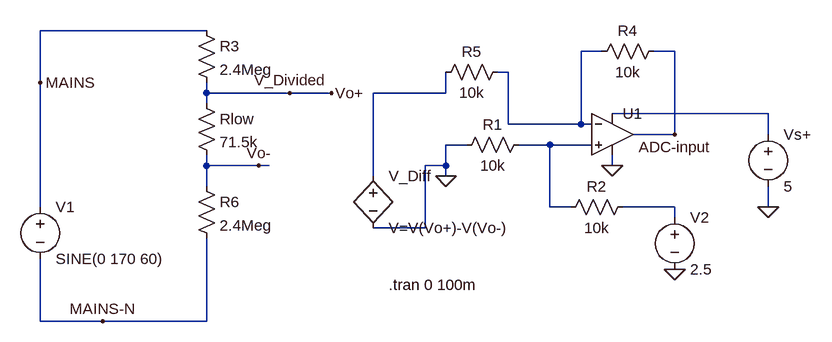
[diagram p0: schematic non-inverting_summing_amp.asc]
non-inverting_summing_amp.asc, the LTspice schematic file:
Version 4
SHEET 1 880 680
WIRE -176 -112 -432 -112
WIRE 432 -80 400 -80
WIRE 544 -80 512 -80
WIRE 288 -48 272 -48
WIRE -432 -32 -432 -112
WIRE -176 -16 -176 -32
WIRE -48 -16 -176 -16
WIRE 16 -16 -48 -16
WIRE 192 -16 192 -48
WIRE 192 -16 80 -16
WIRE -176 0 -176 -16
WIRE 688 16 448 16
WIRE 288 32 288 -48
WIRE 400 32 400 -80
WIRE 400 32 288 32
WIRE 416 32 400 32
WIRE 544 48 544 -80
WIRE 544 48 480 48
WIRE 688 48 688 16
WIRE 224 64 192 64
WIRE 352 64 304 64
WIRE 416 64 352 64
WIRE -176 96 -176 80
WIRE -96 96 -176 96
WIRE -80 96 -96 96
WIRE 192 96 192 64
WIRE 192 96 160 96
WIRE 448 96 448 80
WIRE 80 112 80 -16
WIRE 192 112 192 96
WIRE -176 128 -176 96
WIRE -432 160 -432 -32
WIRE 352 160 352 64
WIRE 384 160 352 160
WIRE 544 160 464 160
WIRE 688 160 688 128
WIRE 544 176 544 160
WIRE 160 192 160 96
WIRE 160 192 80 192
WIRE -432 336 -432 240
WIRE -336 336 -432 336
WIRE -176 336 -176 208
WIRE -176 336 -336 336
FLAG 544 256 0
FLAG 544 48 ADC-input
FLAG 16 -16 Vo+
FLAG 192 112 0
FLAG -96 96 Vo-
FLAG -432 -32 MAINS
FLAG -48 -16 V_Divided
FLAG -336 336 MAINS-N
FLAG 448 96 0
FLAG 688 160 0
SYMBOL voltage -432 144 R0
WINDOW 123 0 0 Left 0
WINDOW 39 0 0 Left 0
SYMATTR InstName V1
SYMATTR Value SINE(0 170 60)
SYMBOL OpAmps\\UniversalOpAmp 448 48 R0
SYMATTR InstName U1
SYMBOL res 320 48 R90
WINDOW 0 0 56 VBottom 2
WINDOW 3 32 56 VTop 2
SYMATTR InstName R1
SYMATTR Value 10k
SYMBOL res 288 -64 R90
WINDOW 0 0 56 VBottom 2
WINDOW 3 32 56 VTop 2
SYMATTR InstName R5
SYMATTR Value 10k
SYMBOL voltage 544 160 R0
SYMATTR InstName V2
SYMATTR Value 2.5
SYMBOL res 528 -96 R90
WINDOW 0 0 56 VBottom 2
WINDOW 3 32 56 VTop 2
SYMATTR InstName R4
SYMATTR Value 10k
SYMBOL voltage 688 32 R0
WINDOW 123 0 0 Left 0
WINDOW 39 0 0 Left 0
SYMATTR InstName Vs+
SYMATTR Value 5
SYMBOL res 480 144 R90
WINDOW 0 0 56 VBottom 2
WINDOW 3 32 56 VTop 2
SYMATTR InstName R2
SYMATTR Value 10k
SYMBOL res -192 -128 R0
SYMATTR InstName R3
SYMATTR Value 2.4Meg
SYMBOL res -192 -16 R0
SYMATTR InstName Rlow
SYMATTR Value 71.5k
SYMBOL res -192 112 R0
SYMATTR InstName R6
SYMATTR Value 2.4Meg
SYMBOL bv 80 96 R0
SYMATTR InstName V_Diff
SYMATTR Value V=V(Vo+)-V(Vo-)
TEXT 104 280 Left 2 !.tran 0 100m

The netlist it stands for:
* non-inverting_summing_amp.asc
V1 MAINS MAINS-N SINE(0 170 60)
XU1 N004 N001 N003 0 ADC-input level1 Avol=1Meg GBW=10Meg Vos=0 En=0 Enk=0 In=0 Ink=0 Rin=500Meg  ; pins In+ In- V+ V- OUT
R1 N004 0 10k
R5 N001 N002 10k
V2 N005 0 2.5
R4 ADC-input N001 10k
Vs+ N003 0 5
R2 N005 N004 10k
R3 MAINS V_Divided 2.4Meg
Rlow V_Divided Vo- 71.5k
R6 Vo- MAINS-N 2.4Meg
B§V_Diff N002 0 V=V(Vo+)-V(Vo-)
.tran 0 100m
.lib UniversalOpAmp1.lib
.backanno
.end